# Altium schematic sheet Buck-Boost_Sheet.SchDoc (part 1 of 3)
size 420 x 297 mm; SheetNumber: 3; SheetTotal: 4
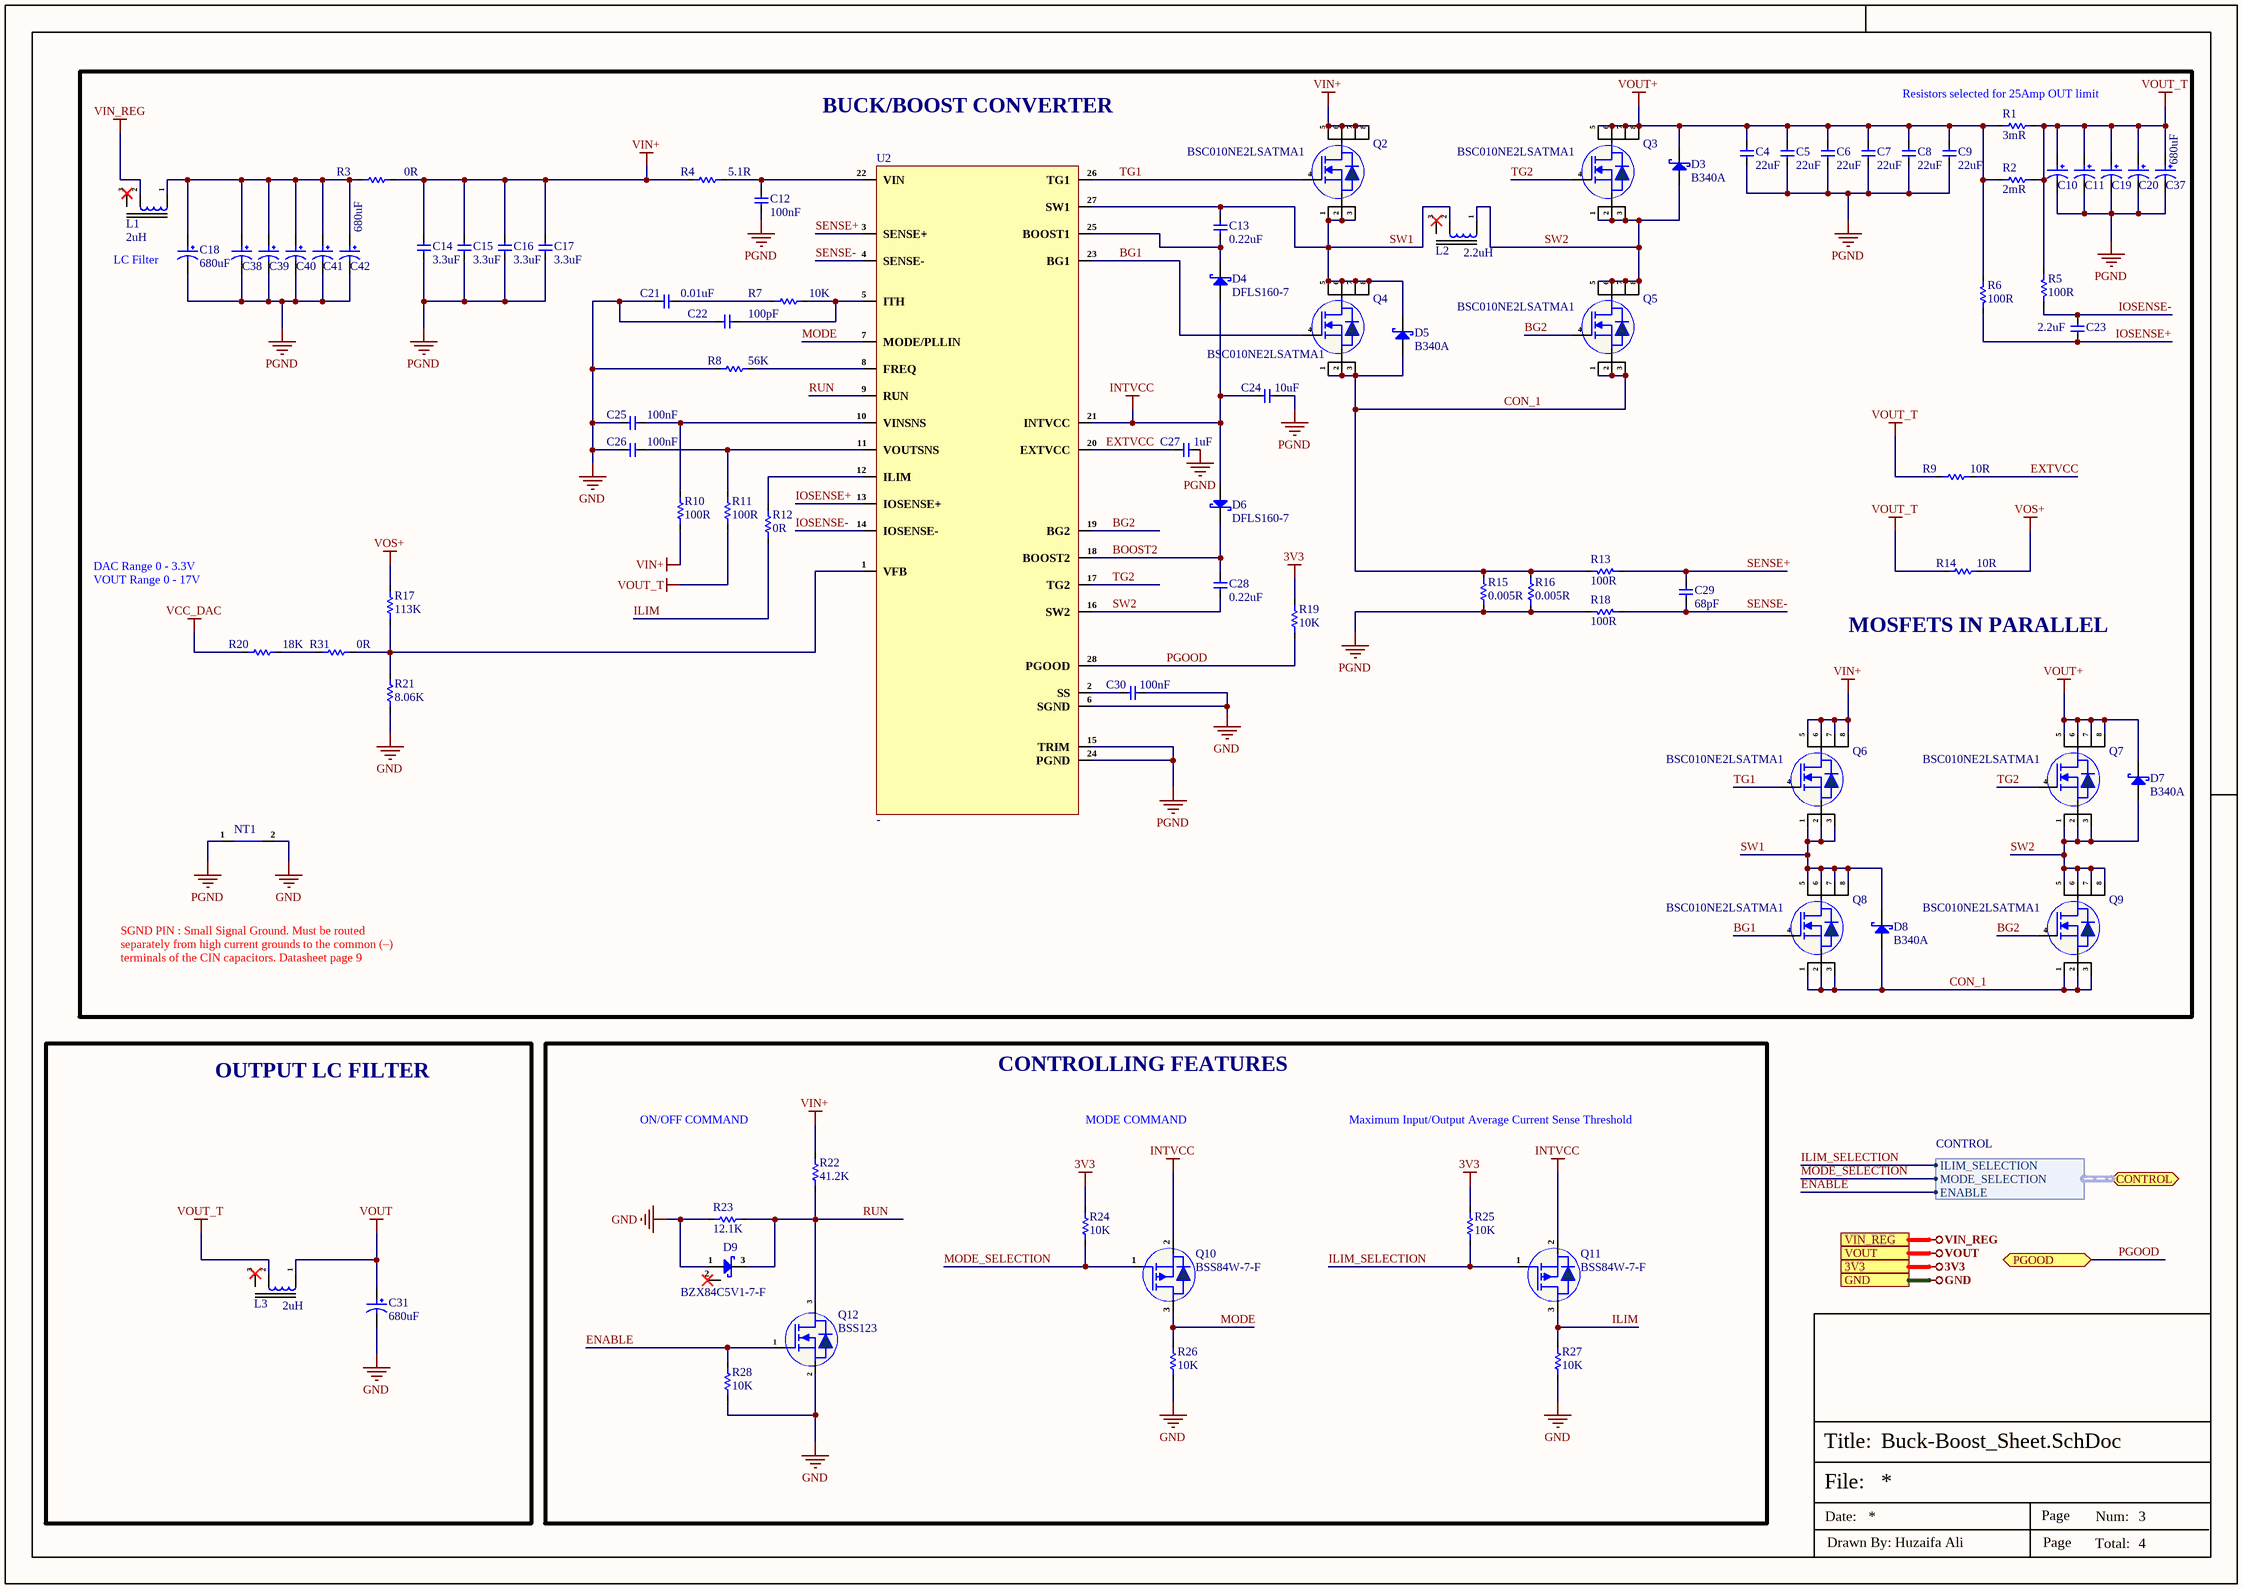
[diagram p0: Buck-Boost_Sheet.SchDoc]

## Parts
C4  22uF  [Cap-1206]
C5  22uF  [Cap-1206]
C6  22uF  [Cap-1206]
C7  22uF  [Cap-1206]
C8  22uF  [Cap-1206]
C9  22uF  [Cap-1206]
C10  680uF  [50PX680MEFC12.5X20]  (value not drawn)
C11  680uF  [50PX680MEFC12.5X20]  (value not drawn)
C12  100nF  [Cap-0603]
C13  0.22uF  [Cap-0402]
C14  3.3uF  [Cap-1210]
C15  3.3uF  [Cap-1210]
C16  3.3uF  [Cap-1210]
C17  3.3uF  [Cap-1210]
C18  680uF  [50PX680MEFC12.5X20]
C19  680uF  [50PX680MEFC12.5X20]  (value not drawn)
C20  680uF  [50PX680MEFC12.5X20]  (value not drawn)
C21  0.01uF  [Cap-0603]
C22  100pF  [Cap-0603]
C23  2.2uF  [CAP-0603]
C24  10uF  [Cap-1206]
C25  100nF  [Cap-0603]
C26  100nF  [Cap-0603]
C27  1uF  [Cap-0603]
C28  0.22uF  [Cap-0402]
C29  68pF  [Cap-0603]
C30  100nF  [Cap-0603]
C31  680uF  [50PX680MEFC12.5X20]
C37  680uF  [50PX680MEFC12.5X20]
C38  680uF  [50PX680MEFC12.5X20]  (value not drawn)
C39  680uF  [50PX680MEFC12.5X20]  (value not drawn)
C40  680uF  [50PX680MEFC12.5X20]  (value not drawn)
C41  680uF  [50PX680MEFC12.5X20]  (value not drawn)
C42  680uF  [50PX680MEFC12.5X20]
D3  B340A  [SMA(DO-214AC)]
D4  DFLS160-7  [PowerDI123]
D5  B340A  [SMA(DO-214AC)]
D6  DFLS160-7  [PowerDI123]
D7  B340A  [SMA(DO-214AC)]
D8  B340A  [SMA(DO-214AC)]
D9  BZX84C5V1-7-F  [SOT-23]
L1  2uH  [SER2011-202MLD]
L2  2.2uH  [SER2915L-222KL]
L3  2uH  [SER2011-202MLD]
NT1  Net Tie_SMD  [Net Tie Pad]  (value not drawn)  (net tie, no BOM)
Q2  BSC010NE2LSATMA1  [PG-TDSON-8-7]
Q3  BSC010NE2LSATMA1  [PG-TDSON-8-7]
Q4  BSC010NE2LSATMA1  [PG-TDSON-8-7]
Q5  BSC010NE2LSATMA1  [PG-TDSON-8-7]
Q6  BSC010NE2LSATMA1  [PG-TDSON-8-7]
Q7  BSC010NE2LSATMA1  [PG-TDSON-8-7]
Q8  BSC010NE2LSATMA1  [PG-TDSON-8-7]
Q9  BSC010NE2LSATMA1  [PG-TDSON-8-7]
Q10  BSS84W-7-F  [SOT-323]
Q11  BSS84W-7-F  [SOT-323]
Q12  BSS123  [SOT-23]
R1  3mR  [RES-2512]
R2  2mR  [RES-2512]
R3  0R  [RES-2512]
R4  5.1R  [RES-0805]
R5  100R  [Res-0603]
R6  100R  [Res-0603]
R7  10K  [Res-0603]
R8  56K  [Res-0603]
R9  10R  [Res-0603]
R10  100R  [Res-0603]
R11  100R  [Res-0603]
R12  0R  [Res-0603]
R13  100R  [Res-0603]
R14  10R  [Res-0603]
R15  0.005R  [RES-2512]
R16  0.005R  [RES-2512]
R17  113K  [Res-0603]
R18  100R  [Res-0603]
R19  10K  [Res-0603]
R20  18K  [Res-0603]
R21  8.06K  [Res-0603]
R22  41.2K  [Res-0603]
R23  12.1K  [Res-0603]
R24  10K  [Res-0603]
R25  10K  [Res-0603]
R26  10K  [Res-0603]
R27  10K  [Res-0603]
R28  10K  [Res-0603]
R31  0R  [Res-0805]
U2  -  [28-SSOP]

## Blocks framed on the sheet
OUTPUT LC FILTER: C31 L3
CONTROLLING FEATURES: D9 Q10-Q12 R22-R28

## Ports
3V3, CONTROL (bidir, harness CONTROL), GND, PGOOD (bidir), VIN_REG, VOUT

## Harnesses
CONTROL: ILIM_SELECTION, MODE_SELECTION, ENABLE

## Nets
3V3: R19.2 R24.2 R25.2 ; port 3V3
GND: C21.1 C22.1 C25.1 C26.1 C30.1 C31.2 D9.1(A) NT1.2 Q12.2(S) R8.1 R21.1 R23.1 R26.1 R27.1 R28.1 U2.6(SGND) ; port GND
INTVCC: C24.1 D4.1(A) D6.1(A) Q10.2(S) Q11.2(S) U2.21(INTVCC)
PGND: C4.1 C5.1 C6.1 C7.1 C8.1 C9.1 C10.2 C11.2 C12.1 C14.1 C15.1 C16.1 C17.1 C18.2 C19.2 C20.2 C24.2 C27.2 C37.2 C38.2 C39.2 C40.2 C41.2 C42.2 NT1.1 R15.1 R16.1 R18.1 U2.15(TRIM) U2.24(PGND)
VCC_DAC: R20.2
VIN+: C14.2 C15.2 C16.2 C17.2 Q2.5(D) Q2.6(D) Q2.7(D) Q2.8(D) Q6.5(D) Q6.6(D) Q6.7(D) Q6.8(D) R3.2 R4.1 R10.1 R22.2
VIN_REG: L1.2 ; port VIN_REG
VOS+: R14.2 R17.2
VOUT: C31.1 L3.1 ; port VOUT
VOUT+: C4.2 C5.2 C6.2 C7.2 C8.2 C9.2 D3.1(K) D7.1(K) Q3.5(D) Q3.6(D) Q3.7(D) Q3.8(D) Q7.5(D) Q7.6(D) Q7.7(D) Q7.8(D) R1.1 R2.1 R6.2
VOUT_T: C10.1 C11.1 C19.1 C20.1 C37.1 L3.2 R1.2 R2.2 R5.2 R9.1 R11.1 R14.1
BG1: Q4.4(G) Q8.4(G) U2.23(BG1)
BG2: Q5.4(G) Q9.4(G) U2.19(BG2)
BOOST2: C28.2 D6.2(K) U2.18(BOOST2)
CON_1: D5.2(A) D8.2(A) Q4.1(S) Q4.2(S) Q4.3(S) Q5.1(S) Q5.2(S) Q5.3(S) Q8.1(S) Q8.2(S) Q8.3(S) Q9.1(S) Q9.2(S) Q9.3(S) R13.1 R15.2 R16.2
ENABLE: Q12.1(G) R28.2 ; port CONTROL.ENABLE
EXTVCC: C27.1 R9.2 U2.20(EXTVCC)
ILIM: Q11.3(D) R12.1 R27.2
ILIM_SELECTION: Q11.1(G) R25.1 ; port CONTROL.ILIM_SELECTION
IOSENSE+: C23.1 R6.1 U2.13(IOSENSE+)
IOSENSE-: C23.2 R5.1 U2.14(IOSENSE-)
MODE: Q10.3(D) R26.2 U2.7(MODE/PLLIN)
MODE_SELECTION: Q10.1(G) R24.1 ; port CONTROL.MODE_SELECTION
PGOOD: R19.1 U2.28(PGOOD) ; port PGOOD
RUN: D9.3(K) Q12.3(D) R22.1 R23.2 U2.9(RUN)
SENSE+: C29.2 R13.2 U2.3(SENSE+)
SENSE-: C29.1 R18.2 U2.4(SENSE-)
SW1: C13.2 D5.1(K) D8.1(K) L2.2 Q2.1(S) Q2.2(S) Q2.3(S) Q4.5(D) Q4.6(D) Q4.7(D) Q4.8(D) Q6.1(S) Q6.2(S) Q6.3(S) Q8.5(D) Q8.6(D) Q8.7(D) Q8.8(D) U2.27(SW1)
SW2: C28.1 D3.2(A) D7.2(A) L2.1 Q3.1(S) Q3.2(S) Q3.3(S) Q5.5(D) Q5.6(D) Q5.7(D) Q5.8(D) Q7.1(S) Q7.2(S) Q7.3(S) Q9.5(D) Q9.6(D) Q9.7(D) Q9.8(D) U2.16(SW2)
TG1: Q2.4(G) Q6.4(G) U2.26(TG1)
TG2: Q3.4(G) Q7.4(G) U2.17(TG2)
NetC12_2: C12.2 R4.2 U2.22(VIN)
NetC13_1: C13.1 D4.2(K) U2.25(BOOST1)
NetC18_1: C18.1 C38.1 C39.1 C40.1 C41.1 C42.1 L1.1 R3.1
NetC21_2: C21.2 R7.1
NetC22_2: C22.2 R7.2 U2.5(ITH)
NetC25_2: C25.2 R10.2 U2.10(VINSNS)
NetC26_2: C26.2 R11.2 U2.11(VOUTSNS)
NetC30_2: C30.2 U2.2(SS)
NetR8_2: R8.2 U2.8(FREQ)
NetR12_2: R12.2 U2.12(ILIM)
NetR17_1: R17.1 R21.2 R31.2 U2.1(VFB)
NetR20_1: R20.1 R31.1

Not connected (* = marked no-connect by the designer): D9 2(NC)*; L1 3*; L2 3*; L3 3*

## Notes on the sheet
- BUCK/BOOST CONVERTER
- (near R1) Resistors selected for 25Amp OUT limit
- (near C18) LC Filter
- DAC Range 0 - 3.3V
  VOUT Range 0 - 17V
- (near R14) MOSFETS IN PARALLEL
- SGND PIN : Small Signal Ground. Must be routed separately from high current grounds to the common (–) terminals of the CIN capacitors. Datasheet page 9
- ON/OFF COMMAND
- MODE COMMAND
- Maximum Input/Output Average Current Sense Threshold
- File:
- Title:
- Date:
- Page
- Num:
- Total:
- Drawn By: Huzaifa Ali